# Altium project Fob_Transmitter.PrjPcb (part 1 of 3)
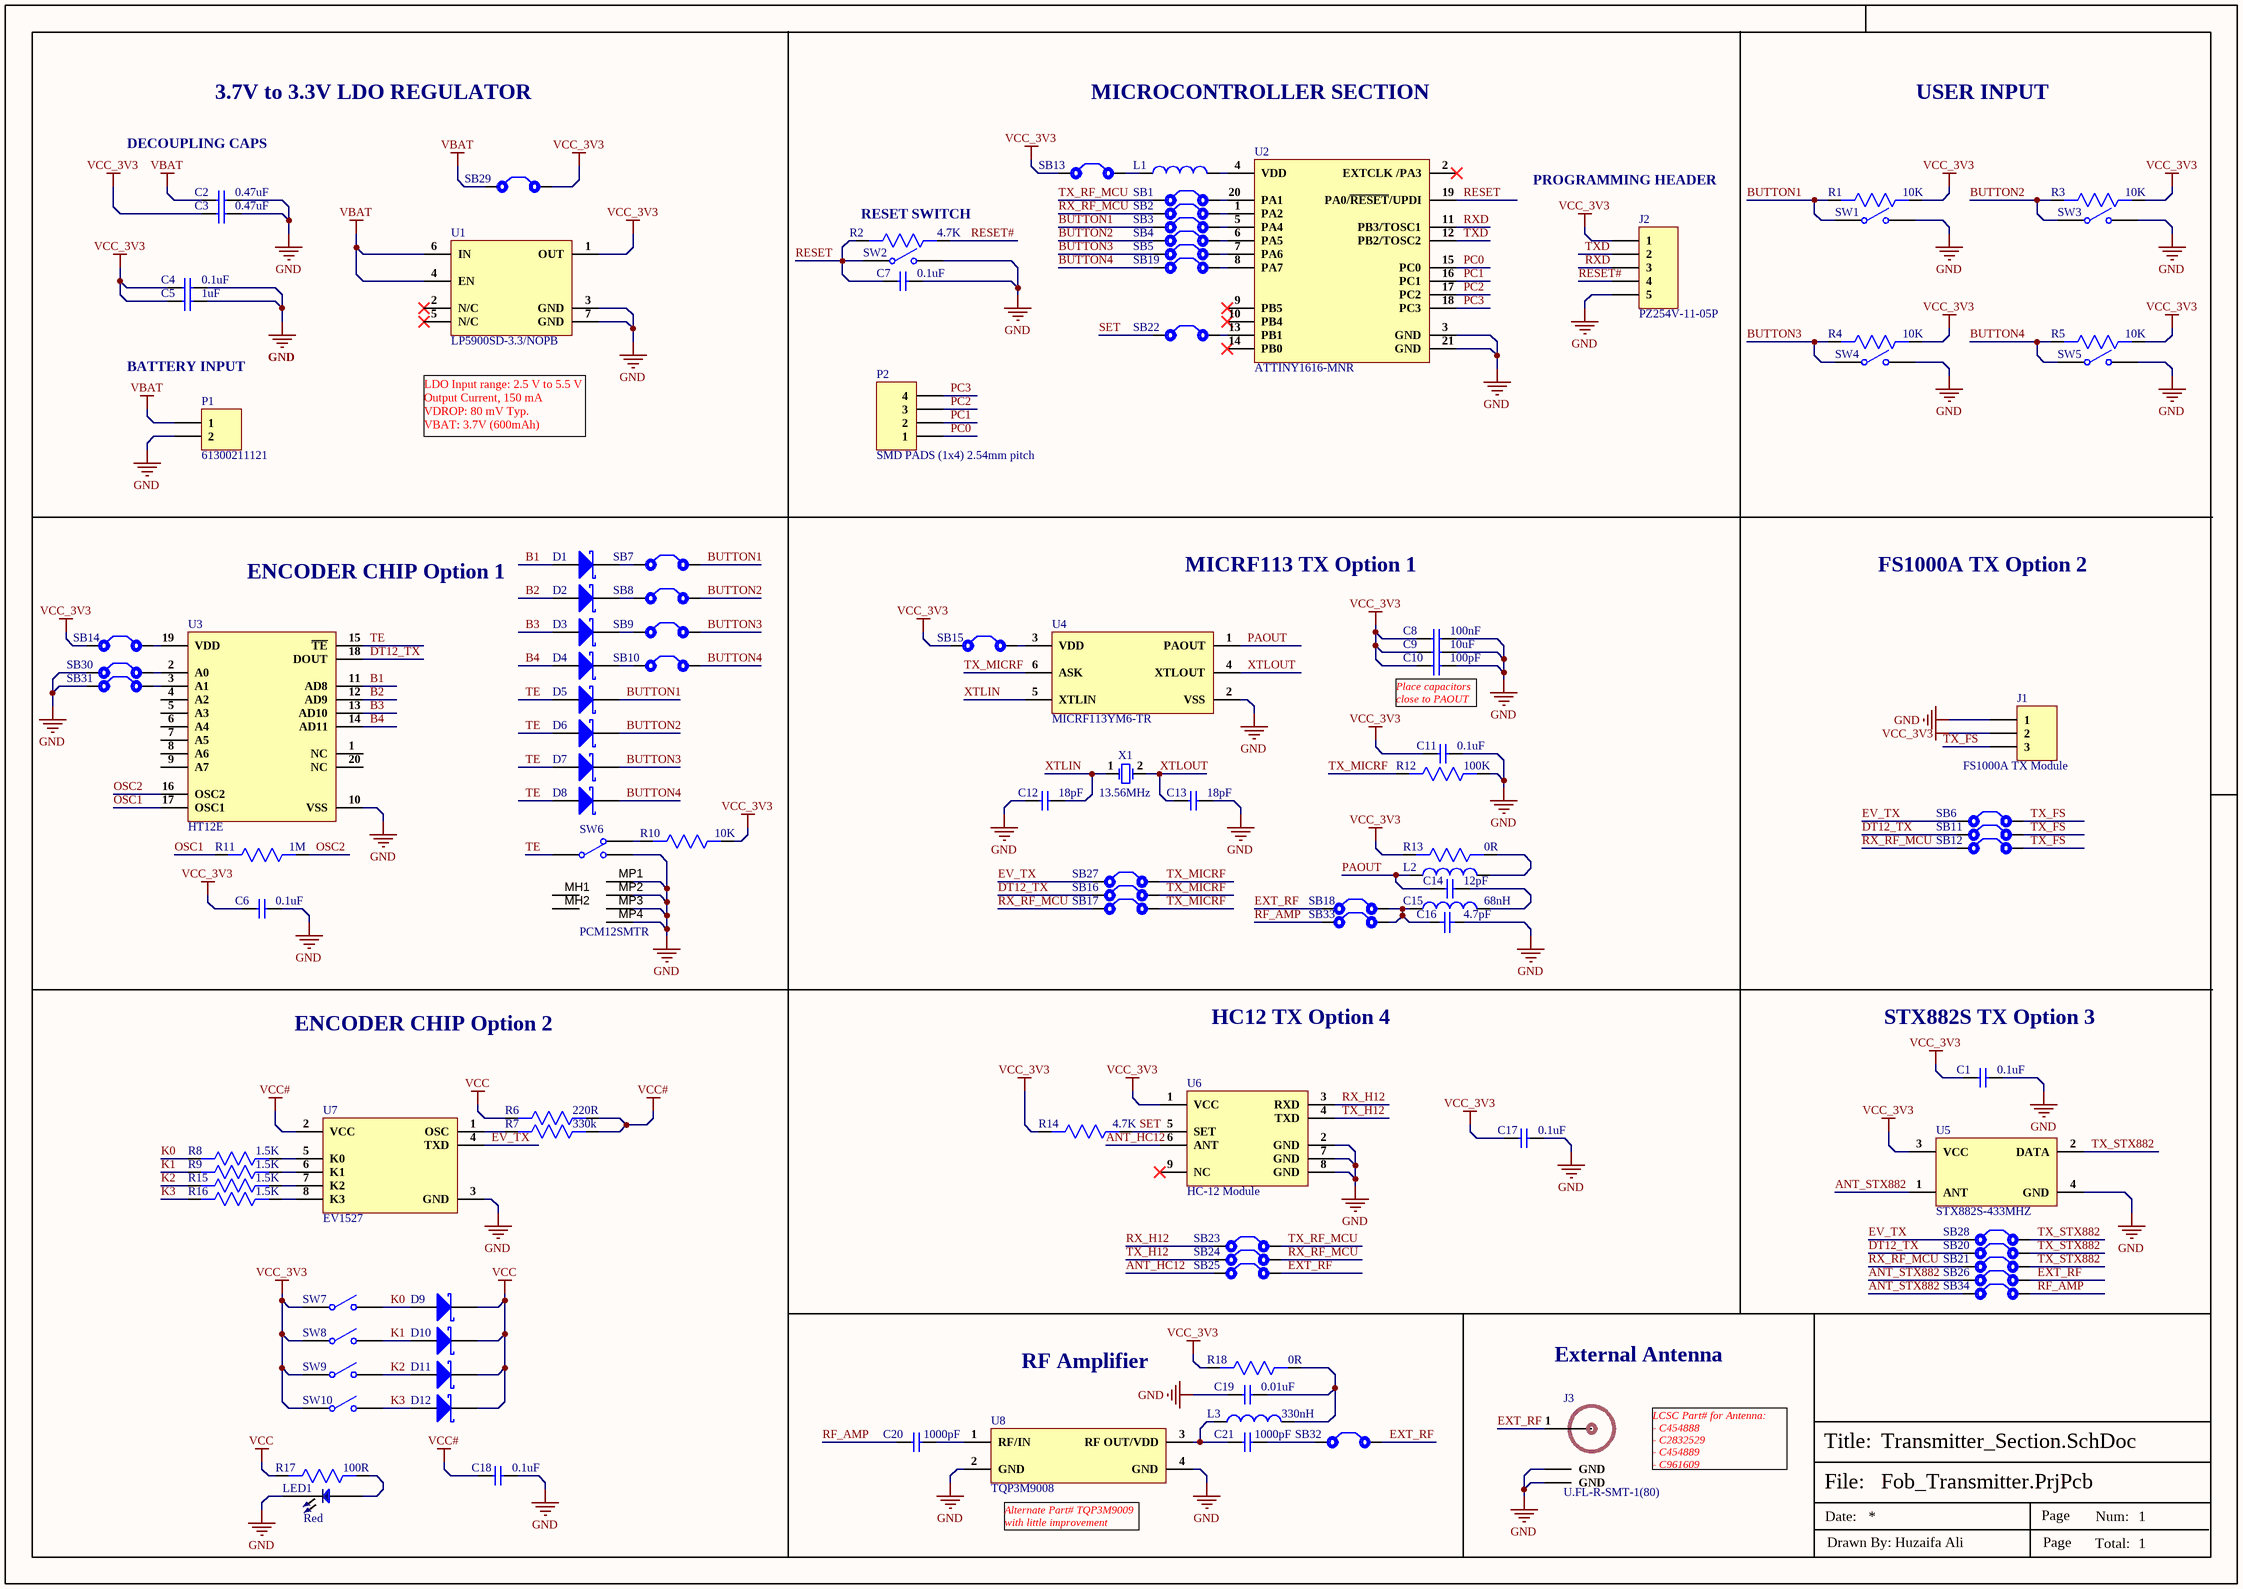
[diagram p0: Transmitter_Section.SchDoc]
1 sheet, 113 parts. Net scope: global (net labels, ports and power ports of the same name join across sheets).
Board file: Transmitter_PCB.PcbDoc

## Sheet Transmitter_Section.SchDoc
size 420 x 297 mm; SheetNumber: 1; SheetTotal: 1

### Parts
C1  0.1uF  [Cap0603]
C2  0.47uF  [Cap0603]
C3  0.47uF  [Cap0603]
C4  0.1uF  [Cap0603]
C5  1uF  [Cap0603]
C6  0.1uF  [Cap0603]
C7  0.1uF  [Cap0603]
C8  100nF  [Cap-0603]
C9  10uF  [Cap-0805]
C10  100pF  [Cap-0603]
C11  0.1uF  [Cap0603]
C12  18pF  [Cap-0603]
C13  18pF  [Cap-0603]
C14  12pF  [Cap-0603]
C15  68nH  [IND-0603 (1608 Metric)]
C16  4.7pF  [Cap-0603]
C17  0.1uF  [Cap0603]
C18  0.1uF  [Cap0603]
C19  0.01uF  [Cap-0603]
C20  1000pF  [Cap-0603]
C21  1000pF  [Cap-0603]
D1  1N4148WS-7-F  [SOD-323]  (value not drawn)
D2  1N4148WS-7-F  [SOD-323]  (value not drawn)
D3  1N4148WS-7-F  [SOD-323]  (value not drawn)
D4  1N4148WS-7-F  [SOD-323]  (value not drawn)
D5  1N4148WS-7-F  [SOD-323]  (value not drawn)
D6  1N4148WS-7-F  [SOD-323]  (value not drawn)
D7  1N4148WS-7-F  [SOD-323]  (value not drawn)
D8  1N4148WS-7-F  [SOD-323]  (value not drawn)
D9  1N4148WS-7-F  [SOD-323]  (value not drawn)
D10  1N4148WS-7-F  [SOD-323]  (value not drawn)
D11  1N4148WS-7-F  [SOD-323]  (value not drawn)
D12  1N4148WS-7-F  [SOD-323]  (value not drawn)
J1  FS1000A TX Module  [DW254W-11-03-85]
J2  PZ254V-11-05P  [HDR1X5]
J3  U.FL-R-SMT-1(80)  [U.FL-R-SMT-1(80)_]
L1  MMZ0603S601CT000  [IND 0201]  (value not drawn)
L2  0805CS-821XJLC  [Ind-0805]  (value not drawn)
L3  330nH  [IND-0603 (1608 Metric)]
LED1  Red  [LED-0402]
P1  61300211121  [HDR1X2]
P2  SMD PADS (1x4) 2.54mm pitch  [SMD PADS (1x4) 2.54mm pitch_]
R1  10K  [Res0603]
R2  4.7K  [Res0603]
R3  10K  [Res0603]
R4  10K  [Res0603]
R5  10K  [Res0603]
R6  220R  [Res-0603]
R7  330k  [Res-0603]
R8  1.5K  [Res-0603]
R9  1.5K  [Res-0603]
R10  10K  [Res0603]
R11  1M  [Res0603]
R12  100K  [Res-0402]
R13  0R  [Res-0603]
R14  4.7K  [Res-0603]
R15  1.5K  [Res-0603]
R16  1.5K  [Res-0603]
R17  100R  [Res-0603]
R18  0R  [Res-0603]
SB1  Solder Bridge  [Solder Bridge]  (value not drawn)
SB2  Solder Bridge  [Solder Bridge]  (value not drawn)
SB3  Solder Bridge  [Solder Bridge]  (value not drawn)
SB4  Solder Bridge  [Solder Bridge]  (value not drawn)
SB5  Solder Bridge  [Solder Bridge]  (value not drawn)
SB6  Solder Bridge  [Solder Bridge]  (value not drawn)
SB7  Solder Bridge  [Solder Bridge]  (value not drawn)
SB8  Solder Bridge  [Solder Bridge]  (value not drawn)
SB9  Solder Bridge  [Solder Bridge]  (value not drawn)
SB10  Solder Bridge  [Solder Bridge]  (value not drawn)
SB11  Solder Bridge  [Solder Bridge]  (value not drawn)
SB12  Solder Bridge  [Solder Bridge]  (value not drawn)
SB13  Solder Bridge  [Solder Bridge]  (value not drawn)
SB14  Solder Bridge  [Solder Bridge]  (value not drawn)
SB15  Solder Bridge  [Solder Bridge]  (value not drawn)
SB16  Solder Bridge  [Solder Bridge]  (value not drawn)
SB17  Solder Bridge  [Solder Bridge]  (value not drawn)
SB18  Solder Bridge  [Solder Bridge]  (value not drawn)
SB19  Solder Bridge  [Solder Bridge]  (value not drawn)
SB20  Solder Bridge  [Solder Bridge]  (value not drawn)
SB21  Solder Bridge  [Solder Bridge]  (value not drawn)
SB22  Solder Bridge  [Solder Bridge]  (value not drawn)
SB23  Solder Bridge  [Solder Bridge]  (value not drawn)
SB24  Solder Bridge  [Solder Bridge]  (value not drawn)
SB25  Solder Bridge  [Solder Bridge]  (value not drawn)
SB26  Solder Bridge  [Solder Bridge]  (value not drawn)
SB27  Solder Bridge  [Solder Bridge]  (value not drawn)
SB28  Solder Bridge  [Solder Bridge]  (value not drawn)
SB29  Solder Bridge  [Solder Bridge]  (value not drawn)
SB30  Solder Bridge  [Solder Bridge]  (value not drawn)
SB31  Solder Bridge  [Solder Bridge]  (value not drawn)
SB32  Solder Bridge  [Solder Bridge]  (value not drawn)
SB33  Solder Bridge  [Solder Bridge]  (value not drawn)
SB34  Solder Bridge  [Solder Bridge]  (value not drawn)
SW1  TS-1185EC-C-D-B  [TS-1185EC-C-D-B]  (value not drawn)
SW2  TS-1185EC-C-D-B  [TS-1185EC-C-D-B]  (value not drawn)
SW3  TS-1185EC-C-D-B  [TS-1185EC-C-D-B]  (value not drawn)
SW4  TS-1185EC-C-D-B  [TS-1185EC-C-D-B]  (value not drawn)
SW5  TS-1185EC-C-D-B  [TS-1185EC-C-D-B]  (value not drawn)
SW6  PCM12SMTR  [PCM12SMTR]
SW7  TS-1185EC-C-D-B  [TS-1185EC-C-D-B]  (value not drawn)
SW8  TS-1185EC-C-D-B  [TS-1185EC-C-D-B]  (value not drawn)
SW9  TS-1185EC-C-D-B  [TS-1185EC-C-D-B]  (value not drawn)
SW10  TS-1185EC-C-D-B  [TS-1185EC-C-D-B]  (value not drawn)
U1  LP5900SD-3.3/NOPB  [WSON-6]
U2  ATTINY1616-MNR  [20-QFN]
U3  HT12E  [SOP-20 (300 Mil)]
U4  MICRF113YM6-TR  [SOT-23-6]
U5  STX882S-433MHZ  [STX882S-433MHZ]
U6  HC-12 Module  [HC-12 Module]
U7  EV1527  [SOP-8]
U8  TQP3M9008  [SOT-89]
X1  13.56MHz  [HC-49S-2P]

### Nets
GND: C1.2 C2.2 C3.2 C4.2 C5.2 C6.2 C7.2 C8.2 C9.2 C10.2 C11.2 C12.1 C13.2 C16.1 C17.2 C18.2 C19.1 J1.1 J2.5 J3.2(GND) J3.3(GND) LED1.2 P1.2 R12.1 SB30.1 SB31.1 SW1.2 SW2.2 SW3.2 SW4.2 SW5.2 SW6.3 SW6.MP1 SW6.MP2 SW6.MP3 SW6.MP4 U1.3(GND) U1.7(GND) U2.3(GND) U2.21(GND) U3.10(VSS) U4.2(VSS) U5.4(GND) U6.2(GND) U6.7(GND) U6.8(GND) U7.3(GND) U8.2(GND) U8.4(GND)
VBAT: C2.1 P1.1 SB29.1 U1.4(EN) U1.6(IN)
VCC: D9.1(K) D10.1(K) D11.1(K) D12.1(K) R6.2 R17.2
VCC#: C18.1 R6.1 R7.1 U7.2(VCC)
VCC_3V3: C1.1 C3.1 C4.1 C5.1 C6.1 C8.1 C9.1 C10.1 C11.1 C17.1 J1.2 J2.1 R1.1 R3.1 R4.1 R5.1 R10.1 R13.2 R14.2 R18.2 SB13.1 SB14.1 SB15.1 SB29.2 SW7.1 SW8.1 SW9.1 SW10.1 U1.1(OUT) U5.3(VCC) U6.1(VCC)
ANT_HC12: SB25.1 U6.6(ANT)
ANT_STX882: SB26.1 SB34.1 U5.1(ANT)
B1: D1.2(A) U3.11(AD8)
B2: D2.2(A) U3.12(AD9)
B3: D3.2(A) U3.13(AD10)
B4: D4.2(A) U3.14(AD11)
BUTTON1: D5.1(K) R1.2 SB3.1 SB7.2 SW1.1
BUTTON2: D6.1(K) R3.2 SB4.1 SB8.2 SW3.1
BUTTON3: D7.1(K) R4.2 SB5.1 SB9.2 SW4.1
BUTTON4: D8.1(K) R5.2 SB10.2 SB19.1 SW5.1
DT12_TX: SB11.1 SB16.1 SB20.1 U3.18(DOUT)
EV_TX: SB6.1 SB27.1 SB28.1 U7.4(TXD)
EXT_RF: J3.1(RF_IN) SB18.1 SB25.2 SB26.2 SB32.2
K0: D9.2(A) R8.2 SW7.2
K1: D10.2(A) R9.2 SW8.2
K2: D11.2(A) R15.2 SW9.2
K3: D12.2(A) R16.2 SW10.2
OSC1: R11.2 U3.17(OSC1)
OSC2: R11.1 U3.16(OSC2)
PAOUT: C14.1 L2.1 U4.1(PAOUT)
PC0: P2.1 U2.15(PC0)
PC1: P2.2 U2.16(PC1)
PC2: P2.3 U2.17(PC2)
PC3: P2.4 U2.18(PC3)
RESET: C7.1 R2.2 SW2.1 U2.19(PA0/~{RESET}/UPDI)
RESET#: J2.4 R2.1
RF_AMP: C20.1 SB33.1 SB34.2
RX_H12: SB23.1 U6.3(RXD)
RX_RF_MCU: SB2.1 SB12.1 SB17.1 SB21.1 SB24.2
RXD: J2.3 U2.11(PB3/TOSC1)
SET: R14.1 SB22.1 U6.5(SET)
TE: D5.2(A) D6.2(A) D7.2(A) D8.2(A) SW6.1 U3.15(~{TE})
TX_FS: J1.3 SB6.2 SB11.2 SB12.2
TX_H12: SB24.1 U6.4(TXD)
TX_MICRF: R12.2 SB16.2 SB17.2 SB27.2 U4.6(ASK)
TX_RF_MCU: SB1.1 SB23.2
TX_STX882: SB20.2 SB21.2 SB28.2 U5.2(DATA)
TXD: J2.2 U2.12(PB2/TOSC2)
XTLIN: C12.2 U4.5(XTLIN) X1.1(OSC1)
XTLOUT: C13.1 U4.4(XTLOUT) X1.2(OSC2)
NetC14_2: C14.2 C15.2
NetC15_1: C15.1 C16.2 SB18.2 SB33.2
NetC19_2: C19.2 L3.2 R18.1
NetC20_2: C20.2 U8.1(RF/IN)
NetC21_1: C21.1 L3.1 U8.3(RF_OUT/VDD)
NetC21_2: C21.2 SB32.1
NetD1_1: D1.1(K) SB7.1
NetD2_1: D2.1(K) SB8.1
NetD3_1: D3.1(K) SB9.1
NetD4_1: D4.1(K) SB10.1
NetL1_1: L1.1 SB13.2
NetL1_2: L1.2 U2.4(VDD)
NetL2_2: L2.2 R13.1
NetLED1_1: LED1.1 R17.1
NetR7_2: R7.2 U7.1(OSC)
NetR8_1: R8.1 U7.5(K0)
NetR9_1: R9.1 U7.6(K1)
NetR10_2: R10.2 SW6.2
NetR15_1: R15.1 U7.7(K2)
NetR16_1: R16.1 U7.8(K3)
NetSB1_2: SB1.2 U2.20(PA1)
NetSB2_2: SB2.2 U2.1(PA2)
NetSB3_2: SB3.2 U2.5(PA4)
NetSB4_2: SB4.2 U2.6(PA5)
NetSB5_2: SB5.2 U2.7(PA6)
NetSB14_2: SB14.2 U3.19(VDD)
NetSB15_2: SB15.2 U4.3(VDD)
NetSB19_2: SB19.2 U2.8(PA7)
NetSB22_2: SB22.2 U2.13(PB1)
NetSB30_2: SB30.2 U3.2(A0)
NetSB31_2: SB31.2 U3.3(A1)

Not connected (* = marked no-connect by the designer): SW6 MH1 MH2; U1 2(N/C)* 5(N/C)*; U2 2(EXTCLK_/PA3)* 9(PB5)* 10(PB4)* 14(PB0)*; U3 1(NC) 4(A2) 5(A3) 6(A4) 7(A5) 8(A6) 9(A7) 20(NC); U6 9(NC)*

### Notes on the sheet
- 3.7V to 3.3V LDO REGULATOR
- MICROCONTROLLER SECTION
- USER INPUT
- DECOUPLING CAPS
- (near J2) PROGRAMMING HEADER
- (near R2) RESET SWITCH
- BATTERY INPUT
- LDO Input range: 2.5 V to 5.5 V
  Output Current, 150 mA
  VDROP: 80 mV Typ.
  VBAT: 3.7V (600mAh)
- ENCODER CHIP Option 1
- MICRF113 TX Option 1
- FS1000A TX Option 2
- (near C10) Place capacitors close to PAOUT
- ENCODER CHIP Option 2
- HC12 TX Option 4
- (near C1) STX882S TX Option 3
- RF Amplifier
- External Antenna
- LCSC Part# for Antenna:
  - C454888
  - C2832529
  - C454889
  - C961609
- (near U8) Alternate Part# TQP3M9009
  with little improvement
- File:
- Title:
- Date:
- Page
- Num:
- Total:
- Drawn By: Huzaifa Ali